# Altium schematic sheet Main_Sheet.SchDoc: =Projectname
size A4; SheetNumber: 1; SheetTotal: 1
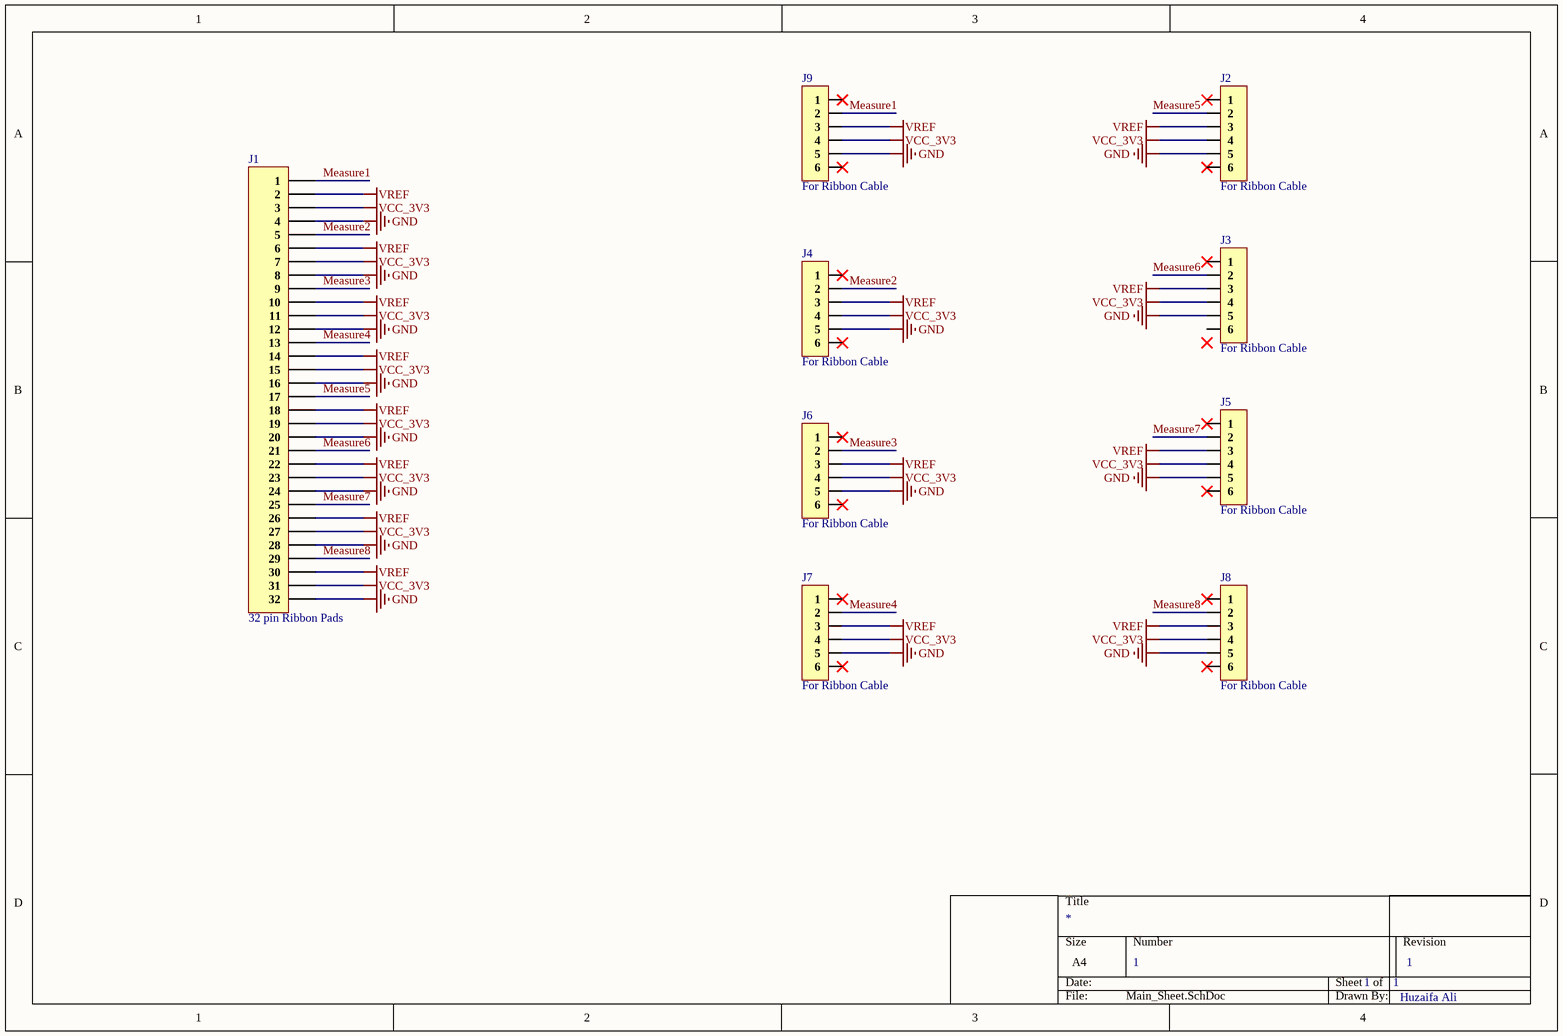
[diagram p0: Main_Sheet.SchDoc]

## Parts
J1  32 pin Ribbon Pads  [32 pin Ribbon Pads.]
J2  For Ribbon Cable  [6 pin Ribbon Pads 0.65mm pitch]
J3  For Ribbon Cable  [6 pin Ribbon Pads 0.65mm pitch]
J4  For Ribbon Cable  [6 pin Ribbon Pads 0.65mm pitch]
J5  For Ribbon Cable  [6 pin Ribbon Pads 0.65mm pitch]
J6  For Ribbon Cable  [6 pin Ribbon Pads 0.65mm pitch]
J7  For Ribbon Cable  [6 pin Ribbon Pads 0.65mm pitch]
J8  For Ribbon Cable  [6 pin Ribbon Pads 0.65mm pitch]
J9  For Ribbon Cable  [6 pin Ribbon Pads 0.65mm pitch]

## Nets
GND: J1.4 J1.8 J1.12 J1.16 J1.20 J1.24 J1.28 J1.32 J2.5 J3.5 J4.5 J5.5 J6.5 J7.5 J8.5 J9.5
VCC_3V3: J1.3 J1.7 J1.11 J1.15 J1.19 J1.23 J1.27 J1.31 J2.4 J3.4 J4.4 J5.4 J6.4 J7.4 J8.4 J9.4
VREF: J1.2 J1.6 J1.10 J1.14 J1.18 J1.22 J1.26 J1.30 J2.3 J3.3 J4.3 J5.3 J6.3 J7.3 J8.3 J9.3
Measure1: J1.1 J9.2
Measure2: J1.5 J4.2
Measure3: J1.9 J6.2
Measure4: J1.13 J7.2
Measure5: J1.17 J2.2
Measure6: J1.21 J3.2
Measure7: J1.25 J5.2
Measure8: J1.29 J8.2

Not connected (* = marked no-connect by the designer): J2 1* 6*; J3 1* 6; J4 1* 6*; J5 1* 6*; J6 1* 6*; J7 1* 6*; J8 1* 6*; J9 1* 6*

## Notes on the sheet
- 1
- Huzaifa Ali

## Library data of the parts
J1 = 32 pin Ribbon Pads: Ribbon wire Connection Pads
J2-J9 = 6 pin Ribbon Pads: Ribbon wire Connection Pads 0.65mm Pitch